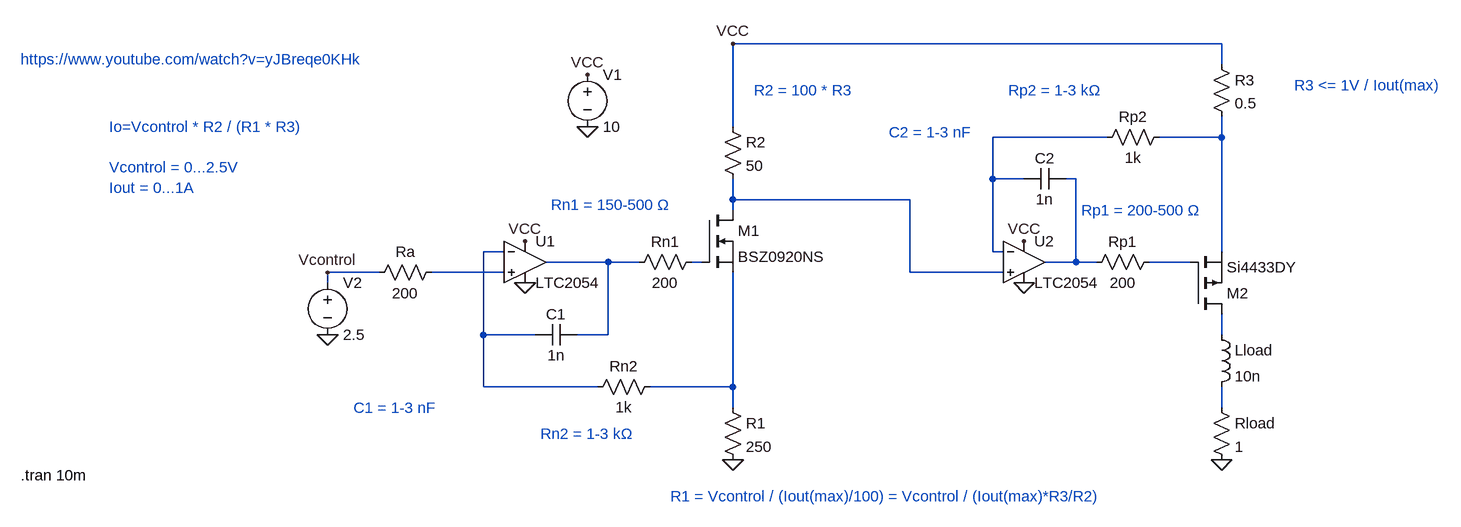
[diagram p0: schematic high_side_current_source.asc]
high_side_current_source.asc, the LTspice schematic file:
Version 4.1
SHEET 1 2212 728
WIRE 1840 16 1088 16
WIRE 1840 48 1840 16
WIRE 1088 144 1088 16
WIRE 1664 160 1488 160
WIRE 1840 160 1840 128
WIRE 1840 160 1744 160
WIRE 1488 224 1488 160
WIRE 1536 224 1488 224
WIRE 1616 224 1600 224
WIRE 1088 256 1088 224
WIRE 1360 256 1088 256
WIRE 1088 272 1088 256
WIRE 736 336 704 336
WIRE 1488 336 1488 224
WIRE 1504 336 1488 336
WIRE 1840 336 1840 160
WIRE 896 352 800 352
WIRE 944 352 896 352
WIRE 1040 352 1024 352
WIRE 1616 352 1616 224
WIRE 1616 352 1568 352
WIRE 1648 352 1616 352
WIRE 1792 352 1728 352
WIRE 544 368 464 368
WIRE 736 368 624 368
WIRE 1360 368 1360 256
WIRE 1504 368 1360 368
WIRE 464 384 464 368
WIRE 704 464 704 336
WIRE 784 464 704 464
WIRE 896 464 896 352
WIRE 896 464 848 464
WIRE 1840 464 1840 432
WIRE 704 544 704 464
WIRE 880 544 704 544
WIRE 1088 544 1088 368
WIRE 1088 544 960 544
WIRE 1088 576 1088 544
WIRE 1840 576 1840 544
FLAG 864 144 0
FLAG 864 64 VCC
FLAG 768 384 0
FLAG 768 320 VCC
FLAG 464 464 0
FLAG 464 368 Vcontrol
FLAG 1536 384 0
FLAG 1536 320 VCC
FLAG 1088 656 0
FLAG 1088 16 VCC
FLAG 1840 656 0
SYMBOL OpAmps\\LTC2054 768 352 R0
SYMATTR InstName U1
SYMBOL voltage 864 48 R0
WINDOW 123 0 0 Left 0
WINDOW 39 0 0 Left 0
SYMATTR InstName V1
SYMATTR Value 10
SYMBOL voltage 464 368 R0
WINDOW 123 0 0 Left 0
WINDOW 39 0 0 Left 0
SYMATTR InstName V2
SYMATTR Value 2.5
SYMBOL res 528 384 R270
WINDOW 0 32 56 VTop 2
WINDOW 3 0 56 VBottom 2
SYMATTR InstName Ra
SYMATTR Value 200
SYMBOL OpAmps\\LTC2054 1536 352 R0
SYMATTR InstName U2
SYMBOL nmos 1040 272 R0
SYMATTR InstName M1
SYMATTR Value BSZ0920NS
SYMBOL res 928 368 R270
WINDOW 0 32 56 VTop 2
WINDOW 3 0 56 VBottom 2
SYMATTR InstName Rn1
SYMATTR Value 200
SYMBOL res 864 560 R270
WINDOW 0 32 56 VTop 2
WINDOW 3 0 56 VBottom 2
SYMATTR InstName Rn2
SYMATTR Value 1k
SYMBOL res 1072 560 R0
SYMATTR InstName R1
SYMATTR Value 250
SYMBOL res 1072 128 R0
SYMATTR InstName R2
SYMATTR Value 50
SYMBOL res 1824 32 R0
SYMATTR InstName R3
SYMATTR Value 0.5
SYMBOL res 1824 560 R0
SYMATTR InstName Rload
SYMATTR Value 1
SYMBOL res 1648 176 R270
WINDOW 0 32 56 VTop 2
WINDOW 3 0 56 VBottom 2
SYMATTR InstName Rp2
SYMATTR Value 1k
SYMBOL res 1632 368 R270
WINDOW 0 32 56 VTop 2
WINDOW 3 0 56 VBottom 2
SYMATTR InstName Rp1
SYMATTR Value 200
SYMBOL cap 848 448 R90
WINDOW 0 0 32 VBottom 2
WINDOW 3 32 32 VTop 2
SYMATTR InstName C1
SYMATTR Value 1n
SYMBOL cap 1600 208 R90
WINDOW 0 0 32 VBottom 2
WINDOW 3 32 32 VTop 2
SYMATTR InstName C2
SYMATTR Value 1n
SYMBOL pmos 1792 432 M180
SYMATTR InstName M2
SYMATTR Value Si4433DY
SYMBOL ind 1824 448 R0
SYMATTR InstName Lload
SYMATTR Value 10n
TEXT -8 40 Left 2 ;https://www.youtube.com/watch?v=yJBreqe0KHk
TEXT 128 144 Left 2 ;Io=Vcontrol * R2 / (R1 * R3)\n \nVcontrol = 0...2.5V\nIout = 0...1A
TEXT -8 680 Left 2 !.tran 10m
TEXT 808 264 Left 2 ;Rn1 = 150-500 Ω
TEXT 1624 272 Left 2 ;Rp1 = 200-500 Ω
TEXT 1512 88 Left 2 ;Rp2 = 1-3 kΩ
TEXT 792 616 Left 2 ;Rn2 = 1-3 kΩ
TEXT 504 576 Left 2 ;C1 = 1-3 nF
TEXT 1328 152 Left 2 ;C2 = 1-3 nF
TEXT 1952 80 Left 2 ;R3 <= 1V / Iout(max)
TEXT 1120 88 Left 2 ;R2 = 100 * R3
TEXT 992 712 Left 2 ;R1 = Vcontrol / (Iout(max)/100) = Vcontrol / (Iout(max)*R3/R2)

The netlist it stands for:
* high_side_current_source.asc
X§U1 N009 N005 N006 VCC 0 LTC2054  ; pins In+ In- OUT V+ V-
V1 VCC 0 10
V2 Vcontrol 0 2.5
Ra Vcontrol N009 200
X§U2 N004 N001 N003 VCC 0 LTC2054  ; pins In+ In- OUT V+ V-
M1 N004 N007 N011 N011 BSZ0920NS
Rn1 N006 N007 200
Rn2 N005 N011 1k
R1 N011 0 250
R2 VCC N004 50
R3 VCC N002 0.5
Rload N012 0 1
Rp2 N001 N002 1k
Rp1 N003 N008 200
C1 N006 N005 1n
C2 N003 N001 1n
M2 N010 N008 N002 N002 Si4433DY
Lload N010 N012 10n
.model NMOS NMOS
.model PMOS PMOS
.lib standard.mos
* https://www.youtube.com/watch?v=yJBreqe0KHk
* Io=Vcontrol * R2 / (R1 * R3)
* Vcontrol = 0...2.5V
* Iout = 0...1A
.tran 10m
* Rn1 = 150-500 Ω
* Rp1 = 200-500 Ω
* Rp2 = 1-3 kΩ
* Rn2 = 1-3 kΩ
* C1 = 1-3 nF
* C2 = 1-3 nF
* R3 <= 1V / Iout(max)
* R2 = 100 * R3
* R1 = Vcontrol / (Iout(max)/100) = Vcontrol / (Iout(max)*R3/R2)
.lib LTC2.lib
.backanno
.end